# Altium project CH32V003J4M6_kit.PrjPCB
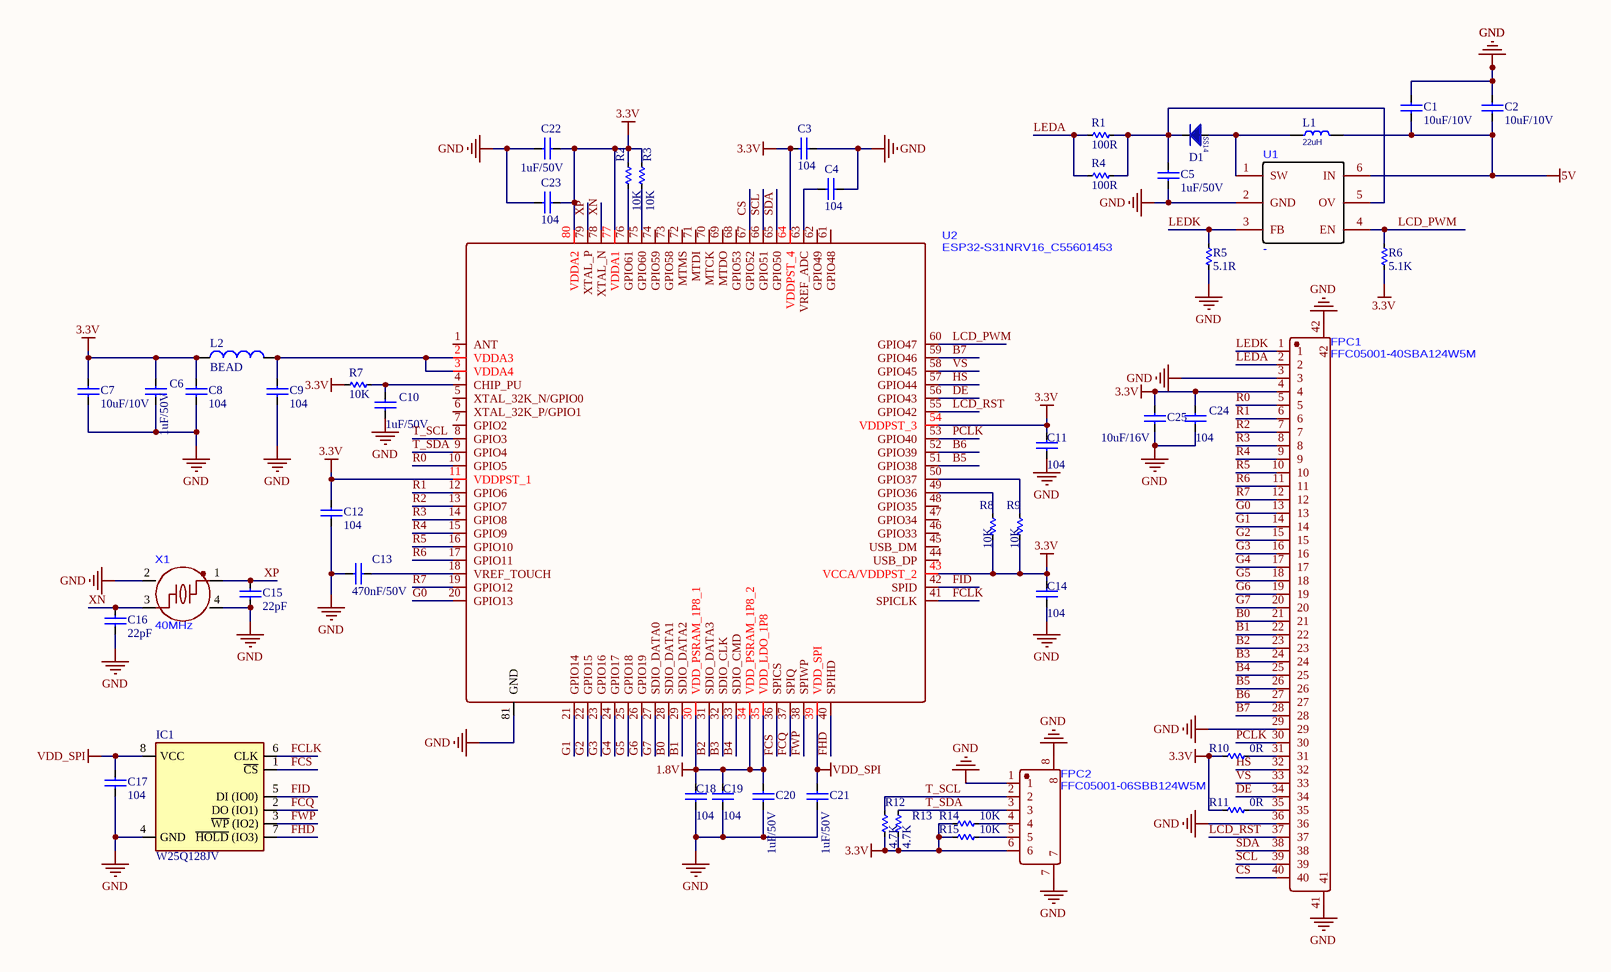
[diagram p0: CH32V003J4M6.SchDoc]
1 sheet, 49 parts. Net scope: global (net labels, ports and power ports of the same name join across sheets).
Board file: pcb.PcbDoc

## Sheet CH32V003J4M6.SchDoc: <Project Name>
size A1; ENG_APP_DATE: --/--/--; DSN_APP_DATE: --/--/--; CHK_APP_DATE: --/--/--; Engineer: Engineer; Address4: Thành phố Hồ Chí Minh; DocumentNumber: 1; Revision: 1.0; SheetNumber: 1; SheetTotal: 1

### Parts
C1  10uF/10V  [C_0805_SMD]
C2  10uF/10V  [C_0805_SMD]
C3  104  [C_0805_SMD]
C4  104  [C_0805_SMD]
C5  1uF/50V  [C_0805_SMD]
C6  1uF/50V  [C_0805_SMD]
C7  10uF/10V  [C_0805_SMD]
C8  104  [C_0805_SMD]
C9  104  [C_0805_SMD]
C10  1uF/50V  [C_0805_SMD]
C11  104  [C_0805_SMD]
C12  104  [C_0805_SMD]
C13  470nF/50V  [C_0805_SMD]
C14  104  [C_0805_SMD]
C15  22pF  [C_0805_SMD]
C16  22pF  [C_0805_SMD]
C17  104  [C_0805_SMD]
C18  104  [C_0805_SMD]
C19  104  [C_0805_SMD]
C20  1uF/50V  [C_0805_SMD]
C21  1uF/50V  [C_0805_SMD]
C22  1uF/50V  [C_0805_SMD]
C23  104  [C_0805_SMD]
C24  104  [C_0805_SMD]
C25  10uF/16V  [C_0805_SMD]
D1  1N5819  [D_SMA]  (value not drawn)
FPC1  FFC05001-40SBA124W5M  [FFC-SMD_FFC05001-40SBA124W5M]
FPC2  FFC05001-06SBB124W5M  [FFC-SMD_FFC05001-06SBB124W5M]
IC1  W25Q128JV  [SO_8_W]
L1  22uH  [CD75]
L2  BEAD  [ferrite_bead_0805]
R1  100R  [RES-SMD-0805]
R2  10K  [RES-SMD-0805]
R3  10K  [RES-SMD-0805]
R4  100R  [RES-SMD-0805]
R5  5.1R  [RES-SMD-0805]
R6  5.1K  [RES-SMD-0805]
R7  10K  [RES-SMD-0805]
R8  10K  [RES-SMD-0805]
R9  10K  [RES-SMD-0805]
R10  0R  [RES-SMD-0805]
R11  0R  [RES-SMD-0805]
R12  4.7K  [RES-SMD-0805]
R13  4.7K  [RES-SMD-0805]
R14  10K  [RES-SMD-0805]
R15  10K  [RES-SMD-0805]
U1  -  [SOT-23-6_L2.9-W1.6-P0.95-LS2.8-BR]
U2  ESP32-S31NRV16_C55601453  [QFN-80_L8.0-W8.0-P0.35-BL-EP6.5]
X1  40MHz  [CRYSTAL-SMD_4P-L2.0-W1.6-BL]

### Nets
1.8V: C18.2 C19.2 C20.2 U2.30(VDD_PSRAM_1P8_1) U2.34(VDD_PSRAM_1P8_2) U2.35(VDD_LDO_1P8)
3.3V: C3.2 C6.2 C7.2 C8.2 C11.2 C12.2 C14.2 C22.1 C23.1 C24.2 C25.2 FPC1.4 FPC2.6 L2.2 R2.2 R3.2 R6.2 R7.2 R8.2 R9.2 R10.2 R11.2 R12.2 R13.2 R14.2 R15.2 U2.11(VDDPST_1) U2.43(VCCA/VDDPST_2) U2.54(VDDPST_3) U2.64(VDDPST_4) U2.77(VDDA1) U2.80(VDDA2)
5V: C1.2 C2.2 L1.2 U1.6(IN)
GND: C1.1 C2.1 C3.1 C4.1 C5.1 C6.1 C7.1 C8.1 C9.1 C10.1 C11.1 C12.1 C13.2 C14.1 C15.1 C16.1 C17.1 C18.1 C19.1 C20.1 C21.1 C22.2 C23.2 C24.1 C25.1 FPC1.3 FPC1.29 FPC1.36 FPC1.41 FPC1.42 FPC2.1 FPC2.7 FPC2.8 IC1.4(GND) R5.2 U1.2(GND) U2.81(GND) X1.2(GND) X1.4(GND)
VDD_SPI: C17.2 C21.2 IC1.8(VCC) U2.39(VDD_SPI)
B0: FPC1.21 U2.28(SDIO_DATA1)
B1: FPC1.22 U2.29(SDIO_DATA2)
B2: FPC1.23 U2.31(SDIO_DATA3)
B3: FPC1.24 U2.32(SDIO_CLK)
B4: FPC1.25 U2.33(SDIO_CMD)
B5: FPC1.26 U2.51(GPIO38)
B6: FPC1.27 U2.52(GPIO39)
B7: FPC1.28 U2.59(GPIO46)
CS: FPC1.40 U2.67(GPIO52)
DE: FPC1.34 U2.56(GPIO43)
FCLK: IC1.6(CLK) U2.41(SPICLK)
FCQ: IC1.2(DO_(IO1)) U2.37(SPIQ)
FCS: IC1.1(~{CS}) U2.36(SPICS)
FHD: IC1.7(~{HOLD}_(IO3)) U2.40(SPIHD)
FID: IC1.5(DI_(IO0)) U2.42(SPID)
FWP: IC1.3(~{WP}_(IO2)) U2.38(SPIWP)
G0: FPC1.13 U2.20(GPIO13)
G1: FPC1.14 U2.21(GPIO14)
G2: FPC1.15 U2.22(GPIO15)
G3: FPC1.16 U2.23(GPIO16)
G4: FPC1.17 U2.24(GPIO17)
G5: FPC1.18 U2.25(GPIO18)
G6: FPC1.19 U2.26(GPIO19)
G7: FPC1.20 U2.27(SDIO_DATA0)
HS: FPC1.32 U2.57(GPIO44)
LCD_PWM: R6.1 U1.4(EN) U2.60(GPIO47)
LCD_RST: FPC1.37 U2.55(GPIO42)
LEDA: FPC1.2 R1.2 R4.2
LEDK: FPC1.1 R5.1 U1.3(FB)
PCLK: FPC1.30 U2.53(GPIO40)
R0: FPC1.5 U2.10(GPIO5)
R1: FPC1.6 U2.12(GPIO6)
R2: FPC1.7 U2.13(GPIO7)
R3: FPC1.8 U2.14(GPIO8)
R4: FPC1.9 U2.15(GPIO9)
R5: FPC1.10 U2.16(GPIO10)
R6: FPC1.11 U2.17(GPIO11)
R7: FPC1.12 U2.19(GPIO12)
SCL: FPC1.39 U2.66(GPIO51)
SDA: FPC1.38 U2.65(GPIO50)
T_SCL: FPC2.2 R12.1 U2.8(GPIO3)
T_SDA: FPC2.3 R13.1 U2.9(GPIO4)
VS: FPC1.33 U2.58(GPIO45)
XN: C16.2 U2.78(XTAL_N) X1.3
XP: C15.2 U2.79(XTAL_P) X1.1
NetC4_2: C4.2 U2.63(VREF_ADC)
NetC5_2: C5.2 D1.2(K) R1.1 R4.1 U1.5(OV)
NetC9_2: C9.2 L2.1 U2.2(VDDA3) U2.3(VDDA4)
NetC10_2: C10.2 R7.1 U2.4(CHIP_PU)
NetC13_1: C13.1 U2.18(VREF_TOUCH)
NetD1_1: D1.1(A) L1.1 U1.1(SW)
NetFPC1_31: FPC1.31 R10.1
NetFPC1_35: FPC1.35 R11.1
NetFPC2_4: FPC2.4 R14.1
NetFPC2_5: FPC2.5 R15.1
NetR2_1: R2.1 U2.76(GPIO61)
NetR3_1: R3.1 U2.75(GPIO60)
NetR8_1: R8.1 U2.49(GPIO36)
NetR9_1: R9.1 U2.50(GPIO37)

Not connected (* = marked no-connect by the designer): U2 1(ANT) 5(XTAL_32K_N/GPIO0) 6(XTAL_32K_P/GPIO1) 7(GPIO2) 44(USB_DP) 45(USB_DM) 46(GPIO33) 47(GPIO34) 48(GPIO35) 61(GPIO48) 62(GPIO49) 68(GPIO53) 69(MTDO) 70(MTCK) 71(MTDI) 72(MTMS) 73(GPIO58) 74(GPIO59)

### Notes on the sheet
- Title
- Size:
- Date:
- A4
- Number:
- Time:
- Revision:
- Sheet
- of
- File:
- (in symbol 1N5819-SS14 SMA) SS14

### Library data of the parts
C1 C2 C7 = Cap 0805 10uF 10V: Tu Dan 10uF 10V, SMD 0805; Code: 1434-100; Designed by: nhox
C3 C4 C8 C9 C11 C12 C14 C17-C19 C23 C24 = Cap 0805 104 100nF: Cap SMD 0805 104-100nF-0.1uF 50V; Code: 1438-080
C5 C6 C10 C20-C22 = Cap 0805 1uF 50V: Cap SMD 0805 105 - 1uF 50V; Code: 1438-092
C13 = Cap 0805 470nF 50V: Cap SMD 0805  470nF 50V; Code: 1438-087
C15 C16 = Cap 0805 22pF 16V: Cap SMD 0805; Code: 1435-024; Designed by: TranLuyen
C25 = Cap 0805 10uF 16V: Cap SMD 0805 10uF 16V; Code: 1435-100
D1 = 1N5819-SS14 SMA: SS14 SMA Diode Schottky 1A 1N5819; Designed by: TranLuyen; Code: N/A
IC1 = W25Q128JV SOIC 8 W: W25Q128JVSSIQ IC Flash 128MBIT; Code: 5015-093
L1 = CD75 7855-220 22uH 1.5A: INDUCTOR, POWER, SMD; Code: 1516-010
L2 = FERRITE BEAD CBG201209U101T: FERRITE BEAD 100 OHM 0805, Impedance @ Frequency: 100 Ohm @ 100MHz, Current Rating (Max): 500mA, DC Resistance (DCR) (Max): 180 mOhm; Code: 1025-302
R1 R4 = Res 100R 0805: Resistor SMD 0805; Code: 1025-063
R2 R3 R7-R9 R14 R15 = Res 10k 0805: Resistor SMD 0805; Code: 1024-111
R5 = Res 5.1R 0805: Resistor SMD 0805; Code: 1024-031
R6 = Res 5.1k 0805: Resistor SMD 0805; Code: 1024-104
R10 R11 = Res 0R 0805: Resistor SMD 0805; Code: 1024-220
R12 R13 = Res 4.7k 0805: Resistor SMD 0805; Code: 1024-103
U1 = PT4103B23F
X1 = 40MHZ/2016/9PF/10PPM

## Assembly variants
giacong: all parts fitted